# Altium project OFP_SCM_v1.6.PrjPcb (part 2 of 2)

## Sheet Isolation-Sheet.SchDoc
size 420 x 297 mm; SheetNumber: 3; SheetTotal: 4
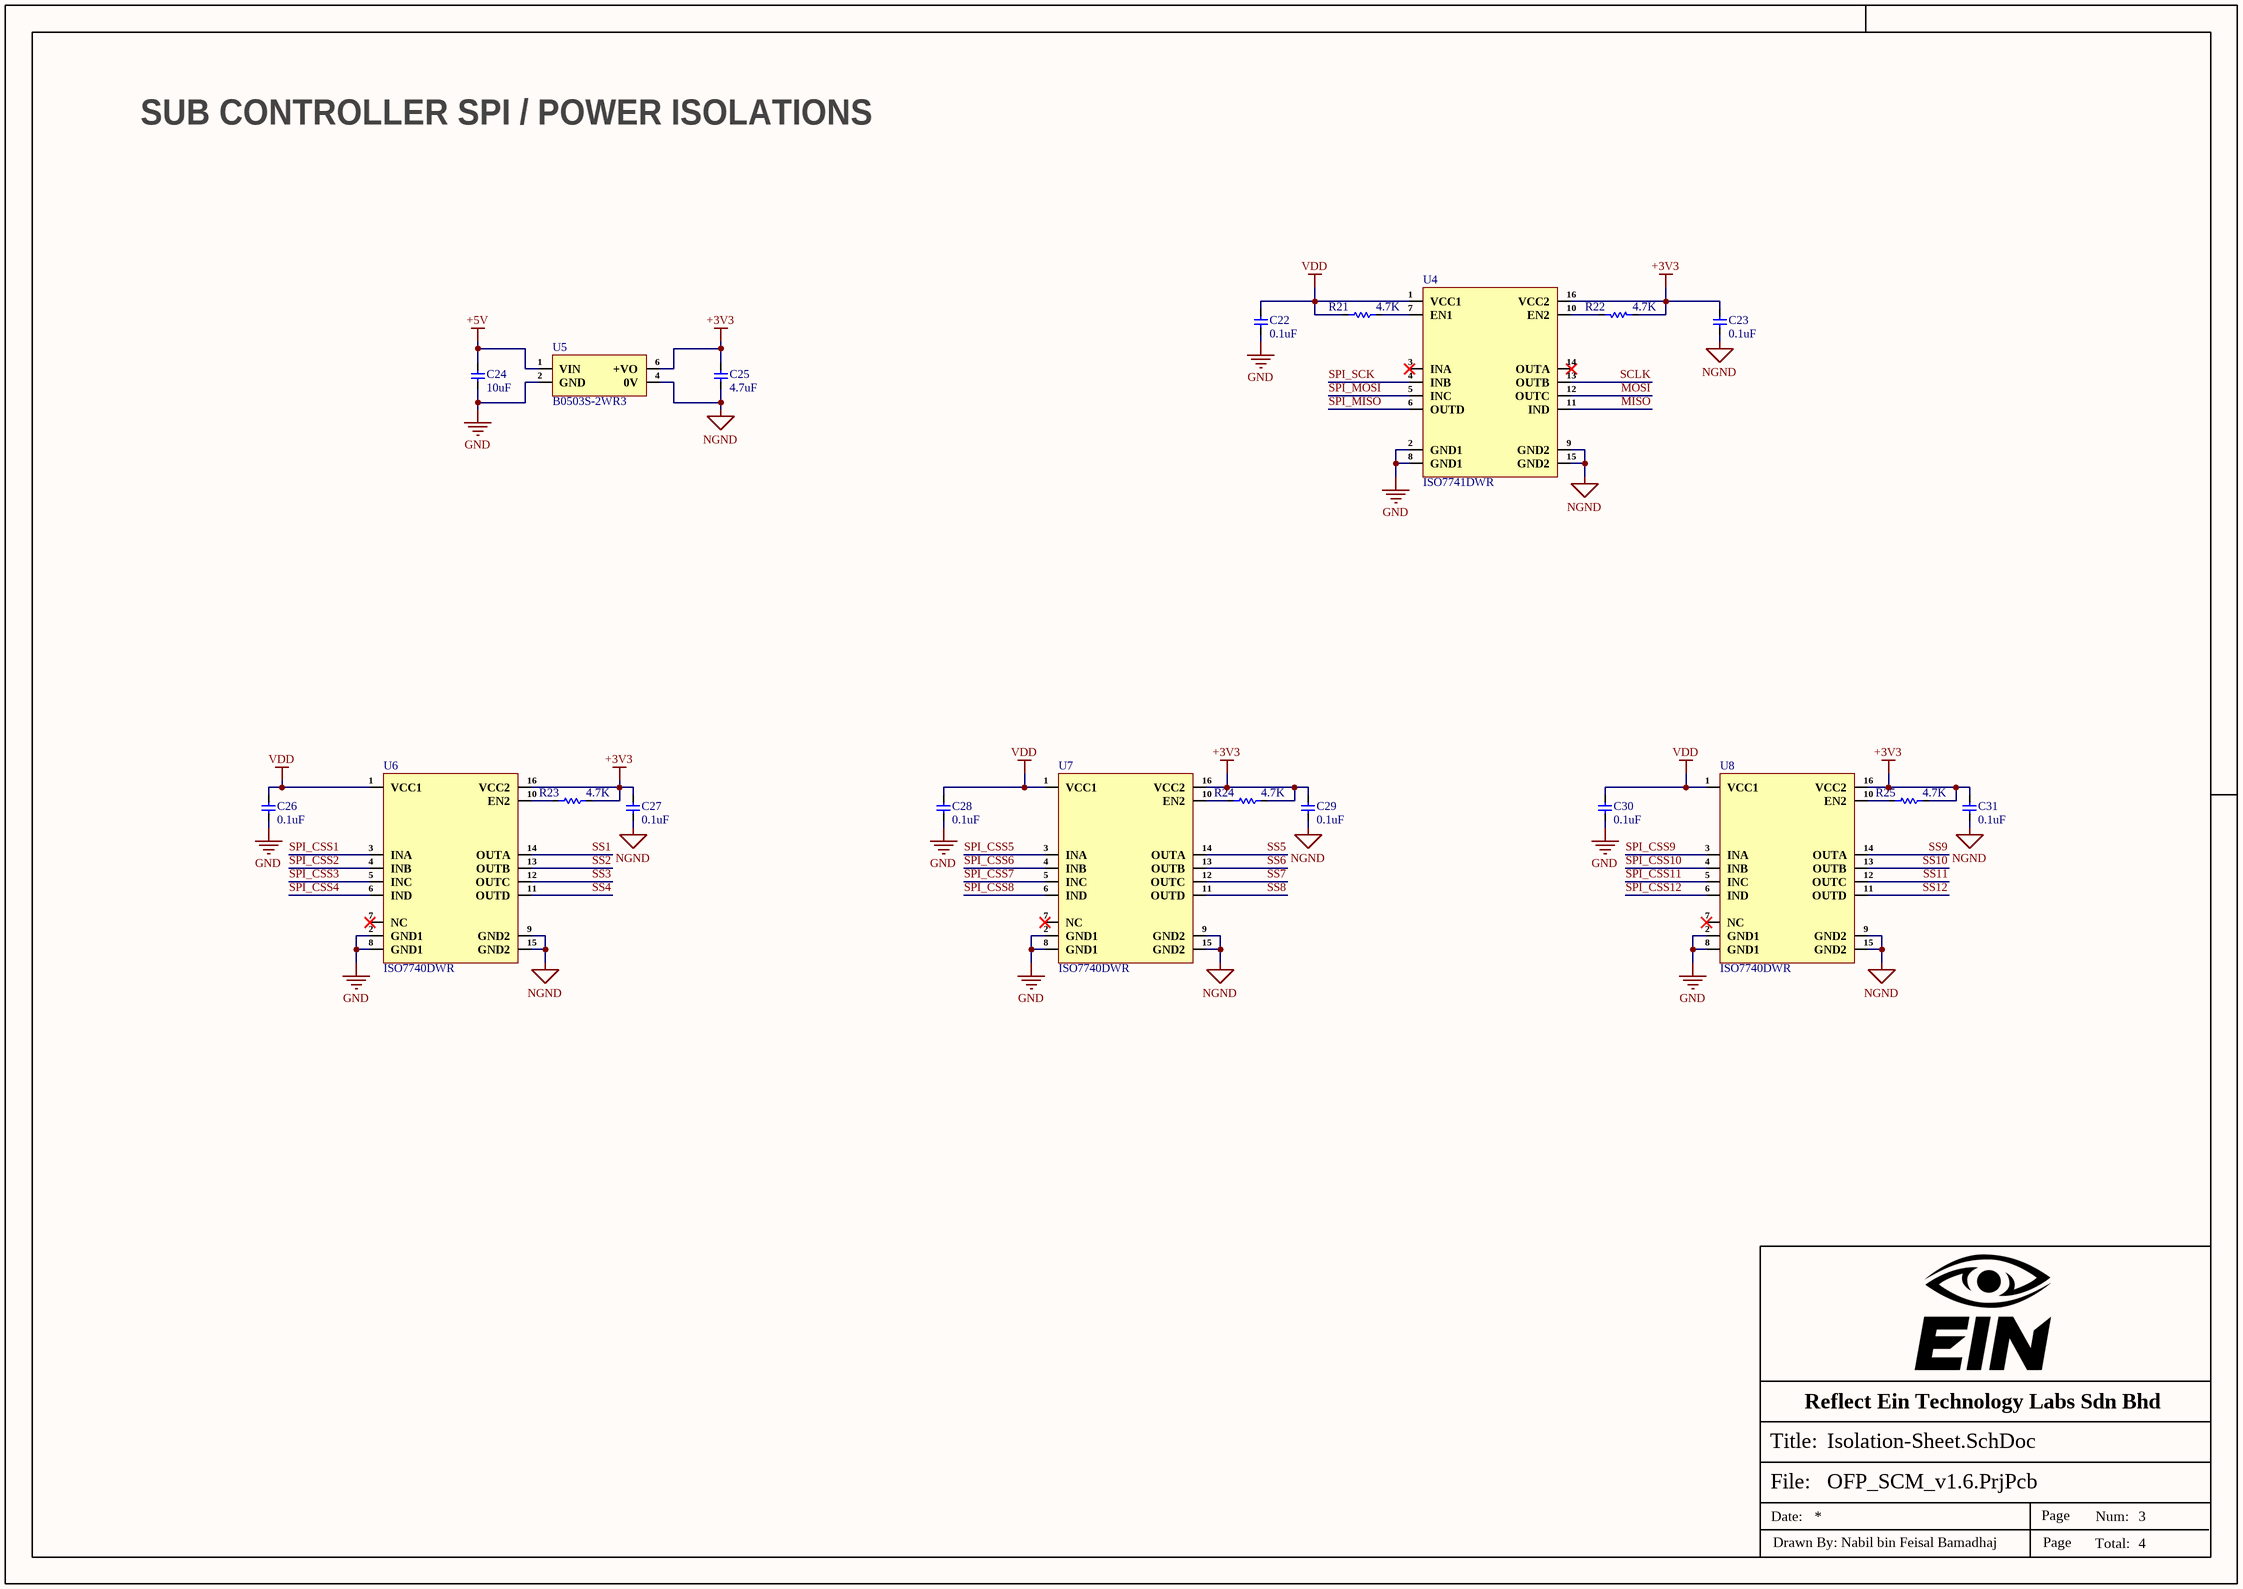
[diagram p2: Isolation-Sheet.SchDoc]

### Parts
C22  0.1uF  [Cap-0603]
C23  0.1uF  [Cap-0603]
C24  10uF  [Cap-0603]
C25  4.7uF  [Cap-0603]
C26  0.1uF  [Cap-0603]
C27  0.1uF  [Cap-0603]
C28  0.1uF  [Cap-0603]
C29  0.1uF  [Cap-0603]
C30  0.1uF  [Cap-0603]
C31  0.1uF  [Cap-0603]
R21  4.7K  [Res-0603]
R22  4.7K  [Res-0603]
R23  4.7K  [Res-0603]
R24  4.7K  [Res-0603]
R25  4.7K  [Res-0603]
U4  ISO7741DWR  [SOIC-16-300mil]
U5  B0503S-2WR3  [B0503S-2WR3]
U6  ISO7740DWR  [SOIC-16-300mil]
U7  ISO7740DWR  [SOIC-16-300mil]
U8  ISO7740DWR  [SOIC-16-300mil]

### Nets
+3V3: C23.2 C25.2 C27.2 C29.2 C31.2 R22.2 R23.1 R24.1 R25.1 U4.16(VCC2) U5.6(+VO) U6.16(VCC2) U7.16(VCC2) U8.16(VCC2)
+5V: C24.2 U5.1(VIN)
GND: C22.1 C24.1 C26.1 C28.1 C30.1 U4.2(GND1) U4.8(GND1) U5.2(GND) U6.2(GND1) U6.8(GND1) U7.2(GND1) U7.8(GND1) U8.2(GND1) U8.8(GND1)
NGND: C23.1 C25.1 C27.1 C29.1 C31.1 U4.9(GND2) U4.15(GND2) U5.4(0V) U6.9(GND2) U6.15(GND2) U7.9(GND2) U7.15(GND2) U8.9(GND2) U8.15(GND2)
VDD: C22.2 C26.2 C28.2 C30.2 R21.2 U4.1(VCC1) U6.1(VCC1) U7.1(VCC1) U8.1(VCC1)
MISO: U4.11(IND)
MOSI: U4.12(OUTC)
SCLK: U4.13(OUTB)
SPI_CSS1: U6.3(INA)
SPI_CSS2: U6.4(INB)
SPI_CSS3: U6.5(INC)
SPI_CSS4: U6.6(IND)
SPI_CSS5: U7.3(INA)
SPI_CSS6: U7.4(INB)
SPI_CSS7: U7.5(INC)
SPI_CSS8: U7.6(IND)
SPI_CSS9: U8.3(INA)
SPI_CSS10: U8.4(INB)
SPI_CSS11: U8.5(INC)
SPI_CSS12: U8.6(IND)
SPI_MISO: U4.6(OUTD)
SPI_MOSI: U4.5(INC)
SPI_SCK: U4.4(INB)
SS1: U6.14(OUTA)
SS2: U6.13(OUTB)
SS3: U6.12(OUTC)
SS4: U6.11(OUTD)
SS5: U7.14(OUTA)
SS6: U7.13(OUTB)
SS7: U7.12(OUTC)
SS8: U7.11(OUTD)
SS9: U8.14(OUTA)
SS10: U8.13(OUTB)
SS11: U8.12(OUTC)
SS12: U8.11(OUTD)
NetR21_1: R21.1 U4.7(EN1)
NetR22_1: R22.1 U4.10(EN2)
NetR23_2: R23.2 U6.10(EN2)
NetR24_2: R24.2 U7.10(EN2)
NetR25_2: R25.2 U8.10(EN2)

Not connected (* = marked no-connect by the designer): U4 3(INA)* 14(OUTA)*; U6 7(NC)*; U7 7(NC)*; U8 7(NC)*

### Notes on the sheet
- SUB CONTROLLER SPI / POWER ISOLATIONS
- Reflect Ein Technology Labs Sdn Bhd
- File:
- Title:
- Date:
- Page
- Num:
- Total:
- Drawn By: Nabil bin Feisal Bamadhaj

### Library data of the parts
C22 C23 C26-C31 = GCJ188R71H104KA12D: CAP CER 0.1UF 50V X7R 0603; Manufacturer: Murata; Item Type: Capacitors; Material: 4241ConductorMaterial; Value: 100nF; Tolerance: 10%; Supplier: Mouser; LCSC Part Number: C161115; Manufacturer Part Number: GCJ188R71H104KA12D; RoHS: Yes; Stock: 342536; Pricing: 1=0.13, 10=0.056, 50=0.056, 100=0.036, 1000=0.032, 10000=0.02 (USD); Mounting Technology: Surface Mount; Case/Package: 0603; Case Code (Metric): 1608; Case Code (Imperial): 0603; Min Operating Temperature: -55°C; Max Operating Temperature: 125°C; Dielectric: X7R; Package Quantity: 1; Voltage Rating: 50V; Packaging: Tape and Reel; Voltage Rating (DC): 50V; Termination: SMD/SMT; Features: Soft Termination; Series: GCJ; Construction: Flat; Length: 1.6mm; Width: 0.031inch; Height: 0.8mm; Thickness: 0.035inch; Depth: 0.8mm; Ratings: AEC-Q200; Radiation Hardening: No; RoHS Compliant: Yes; Lead Free: 5697LeadFree; ComponentLink1URL: https://datasheet.ciiva.com/135/product-135604.pdf?src-supplier=Digikey; ComponentLink1Description: https://datasheet.ciiva.com/135/product-135604.pdf?src-supplier=Digikey; ComponentLink2URL: https://datasheet.ciiva.com/26889/getdatasheetpartid-369886-26889118.pdf?src-supplier=Verical; ComponentLink2Description: https://datasheet.ciiva.com/26889/getdatasheetpartid-369886-26889118.pdf?src-supplier=Verical; ComponentLink3URL: https://datasheet.ciiva.com/135/s0717e-135605.pdf?src-supplier=Digikey; ComponentLink3Description: https://datasheet.ciiva.com/135/s0717e-135605.pdf?src-supplier=Digikey; ComponentLink4URL: https://datasheet.ciiva.com/135/s0717e-135606.pdf?src-supplier=Digikey; ComponentLink4Description: https://datasheet.ciiva.com/135/s0717e-135606.pdf?src-supplier=Digikey; ComponentLink5URL: https://datasheet.ciiva.com/16440/c03e-16440425.pdf?src-supplier=Future+Electronics; ComponentLink5Description: https://datasheet.ciiva.com/16440/c03e-16440425.pdf?src-supplier=Future+Electronics
C24 = GRM188Z71A106KA73D: CAP CER 10UF 10V X7R 0603; Manufacturer: Murata; Item Type: Capacitor; Material: 4241ConductorMaterial; Tolerance: 10%; Supplier: Mouser; LCSC Part Number: C2959727; Manufacturer Part Number: GRM188Z71A106KA73D; RoHS: Yes; Stock: 390983; Pricing: 1=0.36, 10=0.155, 50=0.155, 100=0.104, 1000=0.094, 10000=0.065 (USD); Case/Package: 345Case; Min Operating Temperature: -55°C; Max Operating Temperature: 125°C; Value: 10uF; Voltage Rating: 10V; Length: 1.6mm; Width: 800um; Height: 1mm; Thickness: 800um; RoHS Compliant: Yes; ComponentLink1URL: https://datasheet.octopart.com/GRM188Z71A106KA73D-Murata-datasheet-165579666.pdf?src-supplier=TME; ComponentLink1Description: https://datasheet.octopart.com/GRM188Z71A106KA73D-Murata-datasheet-165579666.pdf?src-supplier=TME
C25 = GRM188Z71A475KE15D: CAP CER 4.7UF 10V X7R 0603; Manufacturer: Murata; Item Type: Capacitors; Material: 4241ConductorMaterial; Tolerance: 10%; Supplier: Mouser; LCSC Part Number: C913474; Manufacturer Part Number: GRM188Z71A475KE15D; RoHS: Yes; Stock: 33218; Pricing: 1=0.24, 10=0.1, 50=0.1, 100=0.063, 1000=0.055, 10000=0.041 (USD); Case/Package: 0603; Min Operating Temperature: -55°C; Max Operating Temperature: 125°C; Value: 4.7uF; Voltage Rating: 10V; Length: 1.6mm; Width: 800um; Height: 950um; Thickness: 800um; RoHS Compliant: Yes; ComponentLink1URL: https://datasheet.octopart.com/GRM188Z71A475KE15D-Murata-datasheet-149523299.pdf?src-supplier=Newark; ComponentLink1Description: https://datasheet.octopart.com/GRM188Z71A475KE15D-Murata-datasheet-149523299.pdf?src-supplier=Newark; ComponentLink2URL: https://datasheet.octopart.com/GRM188Z71A475KE15D-Murata-datasheet-165579666.pdf?src-supplier=TME; ComponentLink2Description: https://datasheet.octopart.com/GRM188Z71A475KE15D-Murata-datasheet-165579666.pdf?src-supplier=TME
R21-R25 = RC0603FR-074K7L: RES SMD 4.7K OHM 1% 1/10W 0603; Manufacturer: Yageo; Item Type: Resistor; Manufacturer Part Number: RC0603FR-074K7L; Package: 0603; ComponentLink7Description: LCSC; ComponentLink7URL: https://www.lcsc.com/product-detail/Chip-Resistor-Surface-Mount_YAGEO-RC0603FR-074K7L_C99782.html; LCSC Part Number: C99782
U4 = ISO7741DWR: DGTL ISO 5000VRMS 4CH GP 16SOIC; Manufacturer: Texas Instruments; Item Type: IC; Number of Channels: 4; Isolated Power: No; Channel Type: Unidirectional; Data Rate: 100Mbps; Propagation Delay: 16ns; Pulse Width Distortion (PWD): 4.9ns; Supplier: Mouser; LCSC Part Number: C571196; Manufacturer Part Number: ISO7741DWR; RoHS: Yes; Stock: 8750; Pricing: 1=2.32, 10=1.36, 50=1.36, 100=1.29, 1000=1.22, 10000=1.1 (USD); Mounting Technology: Surface Mount; Case/Package: SOIC; Pins: 16; Min Operating Temperature: -55°C; Max Operating Temperature: 125°C; Type: General Purpose; Series: -; Packaging: Cut Tape; Lead Free: Lead Free; RoHS Compliant: Yes; ComponentLink1URL: http://www.ti.com/lit/ds/symlink/iso7741.pdf?src-supplier=Digikey; ComponentLink1Description: http://www.ti.com/lit/ds/symlink/iso7741.pdf?src-supplier=Digikey; ComponentLink2URL: http://www.ti.com/general/docs/suppproductinfo.tsp?distId=10&amp;gotoUrl=http%3A%2F%2Fwww.ti.com%2Flit%2Fgpn%2Fiso7741&src-supplier=Digikey; ComponentLink2Description: http://www.ti.com/general/docs/suppproductinfo.tsp?distId=10&amp;gotoUrl=http%3A%2F%2Fwww.ti.com%2Flit%2Fgpn%2Fiso7741&src-supplier=Digikey
U5 = B0503S-2WR3: SIP-4 Isolated Power Modules ROHS; Manufacturer: YLPTEC; Item Type: Module; Manufacturer Part Number: B0503S-2WR3; Package: SIP-4; LCSC Part Number: C5369472; ComponentLink1Description: LCSC; ComponentLink1URL: https://www.lcsc.com/product-detail/Isolated-Power-Modules_YLPTEC-B0503S-2WR3_C5369472.html?s_z=n_B0503S-2WR3
U6-U8 = ISO7740DWR: DGTL ISO 5000VRMS 4CH GP 16SOIC; Manufacturer: Texas Instruments; Item Type: IC; Supplier: Mouser; LCSC Part Number: C529547; Manufacturer Part Number: ISO7740DWR; RoHS: Yes; Stock: 19329; Pricing: 1=2.71, 10=1.85, 50=1.85, 100=1.61, 1000=1.59, 10000=1.59 (USD); Length: 10.3mm; Width: 7.5mm; Height: 2.65mm; Thickness: 2.35mm; Lead Free: 5697LeadFree; ComponentLink1URL: http://www.ti.com/general/docs/lit/getliterature.tsp?genericPartNumber=ISO7740&fileType=pdf&src-supplier=Farnell; ComponentLink1Description: http://www.ti.com/general/docs/lit/getliterature.tsp?genericPartNumber=ISO7740&fileType=pdf&src-supplier=Farnell; ComponentLink2URL: http://www.ti.com/lit/ds/symlink/iso7741.pdf?src-supplier=Digikey; ComponentLink2Description: http://www.ti.com/lit/ds/symlink/iso7741.pdf?src-supplier=Digikey; ComponentLink3URL: http://www.farnell.com/datasheets/2113498.pdf?src-supplier=Element14; ComponentLink3Description: http://www.farnell.com/datasheets/2113498.pdf?src-supplier=Element14; ComponentLink4URL: http://www.ti.com/general/docs/suppproductinfo.tsp?distId=10&amp;gotoUrl=http%3A%2F%2Fwww.ti.com%2Flit%2Fgpn%2Fiso7741&src-supplier=Digikey; ComponentLink4Description: http://www.ti.com/general/docs/suppproductinfo.tsp?distId=10&amp;gotoUrl=http%3A%2F%2Fwww.ti.com%2Flit%2Fgpn%2Fiso7741&src-supplier=Digikey

## Sheet Board-Connectors.SchDoc
size 420 x 297 mm; SheetNumber: 4; SheetTotal: 4
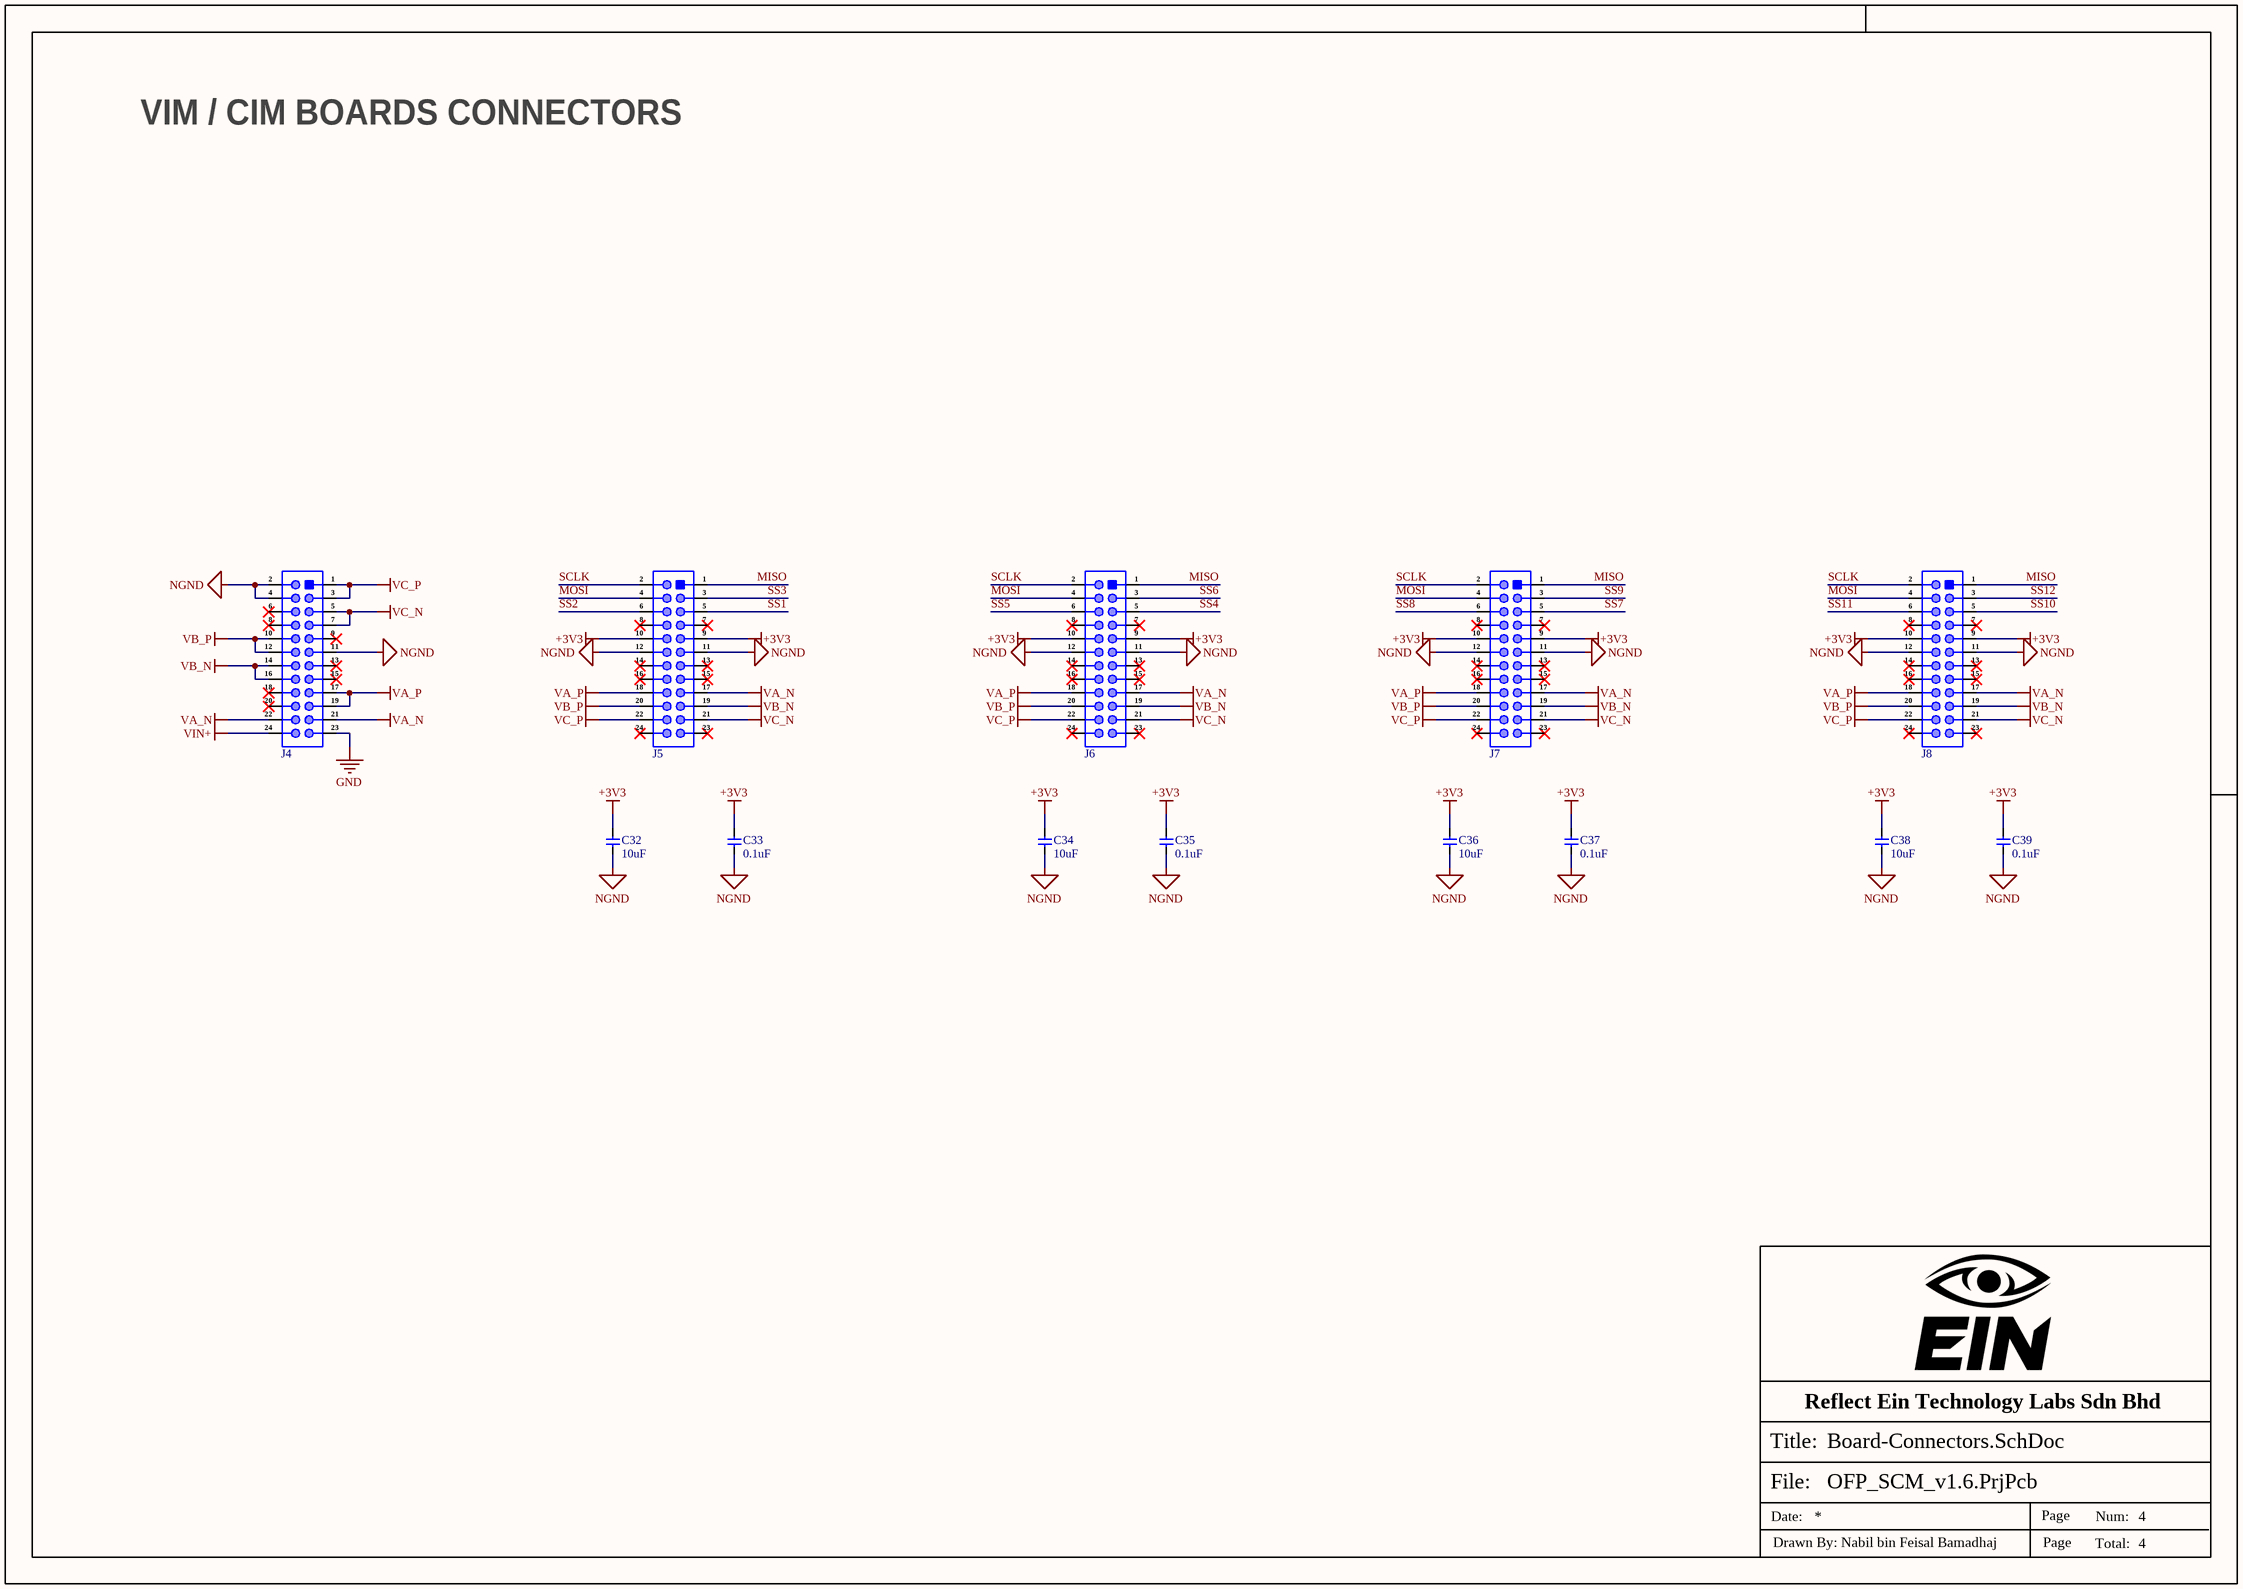
[diagram p3: Board-Connectors.SchDoc]

### Parts
C32  10uF  [Cap-0603]
C33  0.1uF  [Cap-0603]
C34  10uF  [Cap-0603]
C35  0.1uF  [Cap-0603]
C36  10uF  [Cap-0603]
C37  0.1uF  [Cap-0603]
C38  10uF  [Cap-0603]
C39  0.1uF  [Cap-0603]
J4  X9555WV-2x12-6TV01  [X9555WV-2x12-6TV01]  (value not drawn)
J5  X9555WV-2x12-6TV01  [X9555WV-2x12-6TV01]  (value not drawn)
J6  X9555WV-2x12-6TV01  [X9555WV-2x12-6TV01]  (value not drawn)
J7  X9555WV-2x12-6TV01  [X9555WV-2x12-6TV01]  (value not drawn)
J8  X9555WV-2x12-6TV01  [X9555WV-2x12-6TV01]  (value not drawn)

### Nets
+3V3: C32.2 C33.2 C34.2 C35.2 C36.2 C37.2 C38.2 C39.2 J5.9 J5.10 J6.9 J6.10 J7.9 J7.10 J8.9 J8.10
GND: J4.23
NGND: C32.1 C33.1 C34.1 C35.1 C36.1 C37.1 C38.1 C39.1 J4.2 J4.4 J4.11 J5.11 J5.12 J6.11 J6.12 J7.11 J7.12 J8.11 J8.12
VA_N: J4.21 J4.22 J5.17 J6.17 J7.17 J8.17
VA_P: J4.17 J4.19 J5.18 J6.18 J7.18 J8.18
VB_N: J4.14 J4.16 J5.19 J6.19 J7.19 J8.19
VB_P: J4.10 J4.12 J5.20 J6.20 J7.20 J8.20
VC_N: J4.5 J4.7 J5.21 J6.21 J7.21 J8.21
VC_P: J4.1 J4.3 J5.22 J6.22 J7.22 J8.22
VIN+: J4.24
MISO: J5.1 J6.1 J7.1 J8.1
MOSI: J5.4 J6.4 J7.4 J8.4
SCLK: J5.2 J6.2 J7.2 J8.2
SS1: J5.5
SS2: J5.6
SS3: J5.3
SS4: J6.5
SS5: J6.6
SS6: J6.3
SS7: J7.5
SS8: J7.6
SS9: J7.3
SS10: J8.5
SS11: J8.6
SS12: J8.3

Not connected (* = marked no-connect by the designer): J4 6* 8* 9* 13* 15* 18* 20*; J5 7* 8* 13* 14* 15* 16* 23* 24*; J6 7* 8* 13* 14* 15* 16* 23* 24*; J7 7* 8* 13* 14* 15* 16* 23* 24*; J8 7* 8* 13* 14* 15* 16* 23* 24*

### Notes on the sheet
- VIM / CIM BOARDS CONNECTORS
- Reflect Ein Technology Labs Sdn Bhd
- File:
- Title:
- Date:
- Page
- Num:
- Total:
- Drawn By: Nabil bin Feisal Bamadhaj

### Library data of the parts
C32 C34 C36 C38 = GRM188Z71A106KA73D: as C24 on sheet Isolation-Sheet; Supplier: Mouser; LCSC Part Number: C2959727; Manufacturer Part Number: GRM188Z71A106KA73D; RoHS: Yes; Stock: 390983; Pricing: 1=0.36, 10=0.155, 50=0.155, 100=0.104, 1000=0.094, 10000=0.065 (USD); Case/Package: 345Case; Min Operating Temperature: -55°C; Max Operating Temperature: 125°C; Value: 10uF; Voltage Rating: 10V; Length: 1.6mm; Width: 800um; Height: 1mm; Thickness: 800um; RoHS Compliant: Yes; ComponentLink1URL: https://datasheet.octopart.com/GRM188Z71A106KA73D-Murata-datasheet-165579666.pdf?src-supplier=TME; ComponentLink1Description: https://datasheet.octopart.com/GRM188Z71A106KA73D-Murata-datasheet-165579666.pdf?src-supplier=TME
C33 C35 C37 C39 = GCJ188R71H104KA12D: as C22 on sheet Isolation-Sheet; Supplier: Mouser; LCSC Part Number: C161115; Manufacturer Part Number: GCJ188R71H104KA12D; RoHS: Yes; Stock: 342536; Pricing: 1=0.13, 10=0.056, 50=0.056, 100=0.036, 1000=0.032, 10000=0.02 (USD); Mounting Technology: Surface Mount; Case/Package: 0603; Case Code (Metric): 1608; Case Code (Imperial): 0603; Min Operating Temperature: -55°C; Max Operating Temperature: 125°C; Dielectric: X7R; Package Quantity: 1; Voltage Rating: 50V; Packaging: Tape and Reel; Voltage Rating (DC): 50V; Termination: SMD/SMT; Features: Soft Termination; Series: GCJ; Construction: Flat; Length: 1.6mm; Width: 0.031inch; Height: 0.8mm; Thickness: 0.035inch; Depth: 0.8mm; Ratings: AEC-Q200; Radiation Hardening: No; RoHS Compliant: Yes; Lead Free: 5697LeadFree; ComponentLink1URL: https://datasheet.ciiva.com/135/product-135604.pdf?src-supplier=Digikey; ComponentLink1Description: https://datasheet.ciiva.com/135/product-135604.pdf?src-supplier=Digikey; ComponentLink2URL: https://datasheet.ciiva.com/26889/getdatasheetpartid-369886-26889118.pdf?src-supplier=Verical; ComponentLink2Description: https://datasheet.ciiva.com/26889/getdatasheetpartid-369886-26889118.pdf?src-supplier=Verical; ComponentLink3URL: https://datasheet.ciiva.com/135/s0717e-135605.pdf?src-supplier=Digikey; ComponentLink3Description: https://datasheet.ciiva.com/135/s0717e-135605.pdf?src-supplier=Digikey; ComponentLink4URL: https://datasheet.ciiva.com/135/s0717e-135606.pdf?src-supplier=Digikey; ComponentLink4Description: https://datasheet.ciiva.com/135/s0717e-135606.pdf?src-supplier=Digikey; ComponentLink5URL: https://datasheet.ciiva.com/16440/c03e-16440425.pdf?src-supplier=Future+Electronics; ComponentLink5Description: https://datasheet.ciiva.com/16440/c03e-16440425.pdf?src-supplier=Future+Electronics
J4-J8 = X9555WV-2x12-6TV01: 2x12P 24P 2 Tin 2.54mm 2.54mm 12 3A Brass Direct Insert Plugin,P=2.54mm Wire To Board Connector ROHS; Manufacturer: XKB Connectivity; Supplier: LCSC; LCSC Part Number: C692425; Manufacturer Part Number: X9555WV-2x12-6TV01; RoHS: No; Item Type: Wire to Board Connector; Pricing: 5=0.315, 50=0.2544, 250=0.2058, 500=0.1734, 2000=0.1589, 5000=0.1503 (USD)

## Nets that join several sheets
+3V3: Isolation-Sheet (14 pins), Board-Connectors (16 pins)
+5V: Power-Sheet (9 pins), Isolation-Sheet (C24.2 U5.1)
GND: Microcontroller-Sheet (20 pins), Power-Sheet (17 pins), Isolation-Sheet (14 pins), Board-Connectors (J4.23)
NGND: Isolation-Sheet (14 pins), Board-Connectors (19 pins)
VDD: Microcontroller-Sheet (21 pins), Power-Sheet (C20.2 C21.2 R19.2 U3.5), Isolation-Sheet (9 pins)
VIN+: Microcontroller-Sheet (C2.2 J3.8), Power-Sheet (5 pins), Board-Connectors (J4.24)
MISO: Isolation-Sheet (U4.11), Board-Connectors (J5.1 J6.1 J7.1 J8.1)
MOSI: Isolation-Sheet (U4.12), Board-Connectors (J5.4 J6.4 J7.4 J8.4)
SCLK: Isolation-Sheet (U4.13), Board-Connectors (J5.2 J6.2 J7.2 J8.2)
SPI_CSS1: Microcontroller-Sheet (U1.22), Isolation-Sheet (U6.3)
SPI_CSS2: Microcontroller-Sheet (U1.21), Isolation-Sheet (U6.4)
SPI_CSS3: Microcontroller-Sheet (U1.20), Isolation-Sheet (U6.5)
SPI_CSS4: Microcontroller-Sheet (U1.19), Isolation-Sheet (U6.6)
SPI_CSS5: Microcontroller-Sheet (U1.26), Isolation-Sheet (U7.3)
SPI_CSS6: Microcontroller-Sheet (U1.25), Isolation-Sheet (U7.4)
SPI_CSS7: Microcontroller-Sheet (U1.31), Isolation-Sheet (U7.5)
SPI_CSS8: Microcontroller-Sheet (U1.23), Isolation-Sheet (U7.6)
SPI_CSS9: Microcontroller-Sheet (U1.30), Isolation-Sheet (U8.3)
SPI_CSS10: Microcontroller-Sheet (U1.29), Isolation-Sheet (U8.4)
SPI_CSS11: Microcontroller-Sheet (U1.28), Isolation-Sheet (U8.5)
SPI_CSS12: Microcontroller-Sheet (U1.27), Isolation-Sheet (U8.6)
SPI_MISO: Microcontroller-Sheet (U1.12), Isolation-Sheet (U4.6)
SPI_MOSI: Microcontroller-Sheet (U1.9), Isolation-Sheet (U4.5)
SPI_SCK: Microcontroller-Sheet (U1.10), Isolation-Sheet (U4.4)
SS1: Isolation-Sheet (U6.14), Board-Connectors (J5.5)
SS2: Isolation-Sheet (U6.13), Board-Connectors (J5.6)
SS3: Isolation-Sheet (U6.12), Board-Connectors (J5.3)
SS4: Isolation-Sheet (U6.11), Board-Connectors (J6.5)
SS5: Isolation-Sheet (U7.14), Board-Connectors (J6.6)
SS6: Isolation-Sheet (U7.13), Board-Connectors (J6.3)
SS7: Isolation-Sheet (U7.12), Board-Connectors (J7.5)
SS8: Isolation-Sheet (U7.11), Board-Connectors (J7.6)
SS9: Isolation-Sheet (U8.14), Board-Connectors (J7.3)
SS10: Isolation-Sheet (U8.13), Board-Connectors (J8.5)
SS11: Isolation-Sheet (U8.12), Board-Connectors (J8.6)
SS12: Isolation-Sheet (U8.11), Board-Connectors (J8.3)